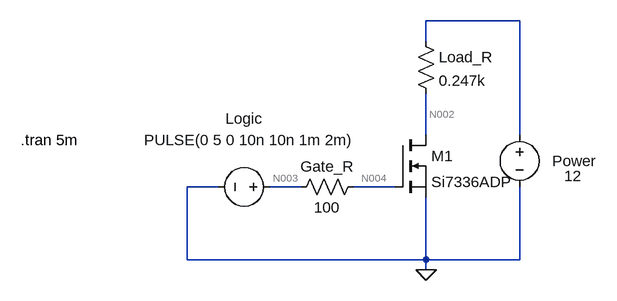
[diagram p0: schematic Logic and Power Control Circuit.asc]
Logic and Power Control Circuit.asc, the LTspice schematic file:
Version 4.1
SHEET 1 880 680
WIRE 272 -224 128 -224
WIRE 128 -192 128 -224
WIRE 128 -48 128 -112
WIRE 272 -48 272 -224
WIRE -192 32 -240 32
WIRE -64 32 -112 32
WIRE 80 32 16 32
WIRE -240 144 -240 32
WIRE 128 144 128 48
WIRE 128 144 -240 144
WIRE 272 144 272 32
WIRE 272 144 128 144
WIRE 128 160 128 144
FLAG 128 160 0
SYMBOL voltage -96 32 R90
WINDOW 0 -90 56 VBottom 2
WINDOW 3 -88 48 VTop 2
WINDOW 123 0 0 Left 0
WINDOW 39 0 0 Left 0
SYMATTR InstName Logic
SYMATTR Value PULSE(0 5 0 10n 10n 1m 2m)
SYMBOL voltage 272 -64 R0
WINDOW 0 50 56 Left 2
WINDOW 3 69 79 Left 2
SYMATTR InstName Power
SYMATTR Value 12
SYMBOL nmos 80 -48 R0
SYMATTR InstName M1
SYMATTR Value Si7336ADP
SYMBOL res 32 16 R90
WINDOW 0 0 56 VBottom 2
WINDOW 3 32 56 VTop 2
SYMATTR InstName Gate_R
SYMATTR Value 100
SYMBOL res 112 -208 R0
SYMATTR InstName Load_R
SYMATTR Value 0.247k
TEXT -496 -40 Left 2 !.tran 5m

The netlist it stands for:
* Logic and Power Control Circuit.asc
V§Logic N003 0 PULSE(0 5 0 10n 10n 1m 2m)
V§Power N001 0 12
M1 N002 N004 0 0 Si7336ADP
R§Gate_R N004 N003 100
R§Load_R N001 N002 0.247k
.model NMOS NMOS
.model PMOS PMOS
.lib standard.mos
.tran 5m
.backanno
.end

* Results of the author's LTspice run, read from the files saved beside the schematic
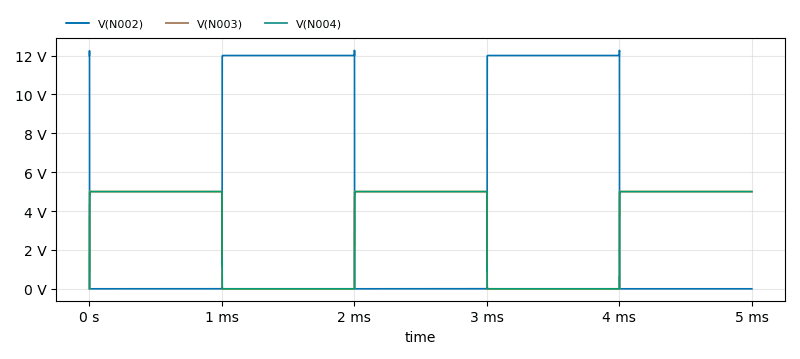
[diagram p1: Transient Analysis of Logic and Power Control Circuit.asc, plotted from the saved traces]
* Transient Analysis, 1 run:
*   V(N002): min 92.86 µV, max 12.26 V, average 4.8 V, rms 7.588 V, last 140.5 µV
*   V(N003): min 0 V, max 5 V, average 3 V, rms 3.873 V, last 5 V
*   V(N004): min -7.361 µV, max 5 V, average 2.999 V, rms 3.871 V, last 5 V